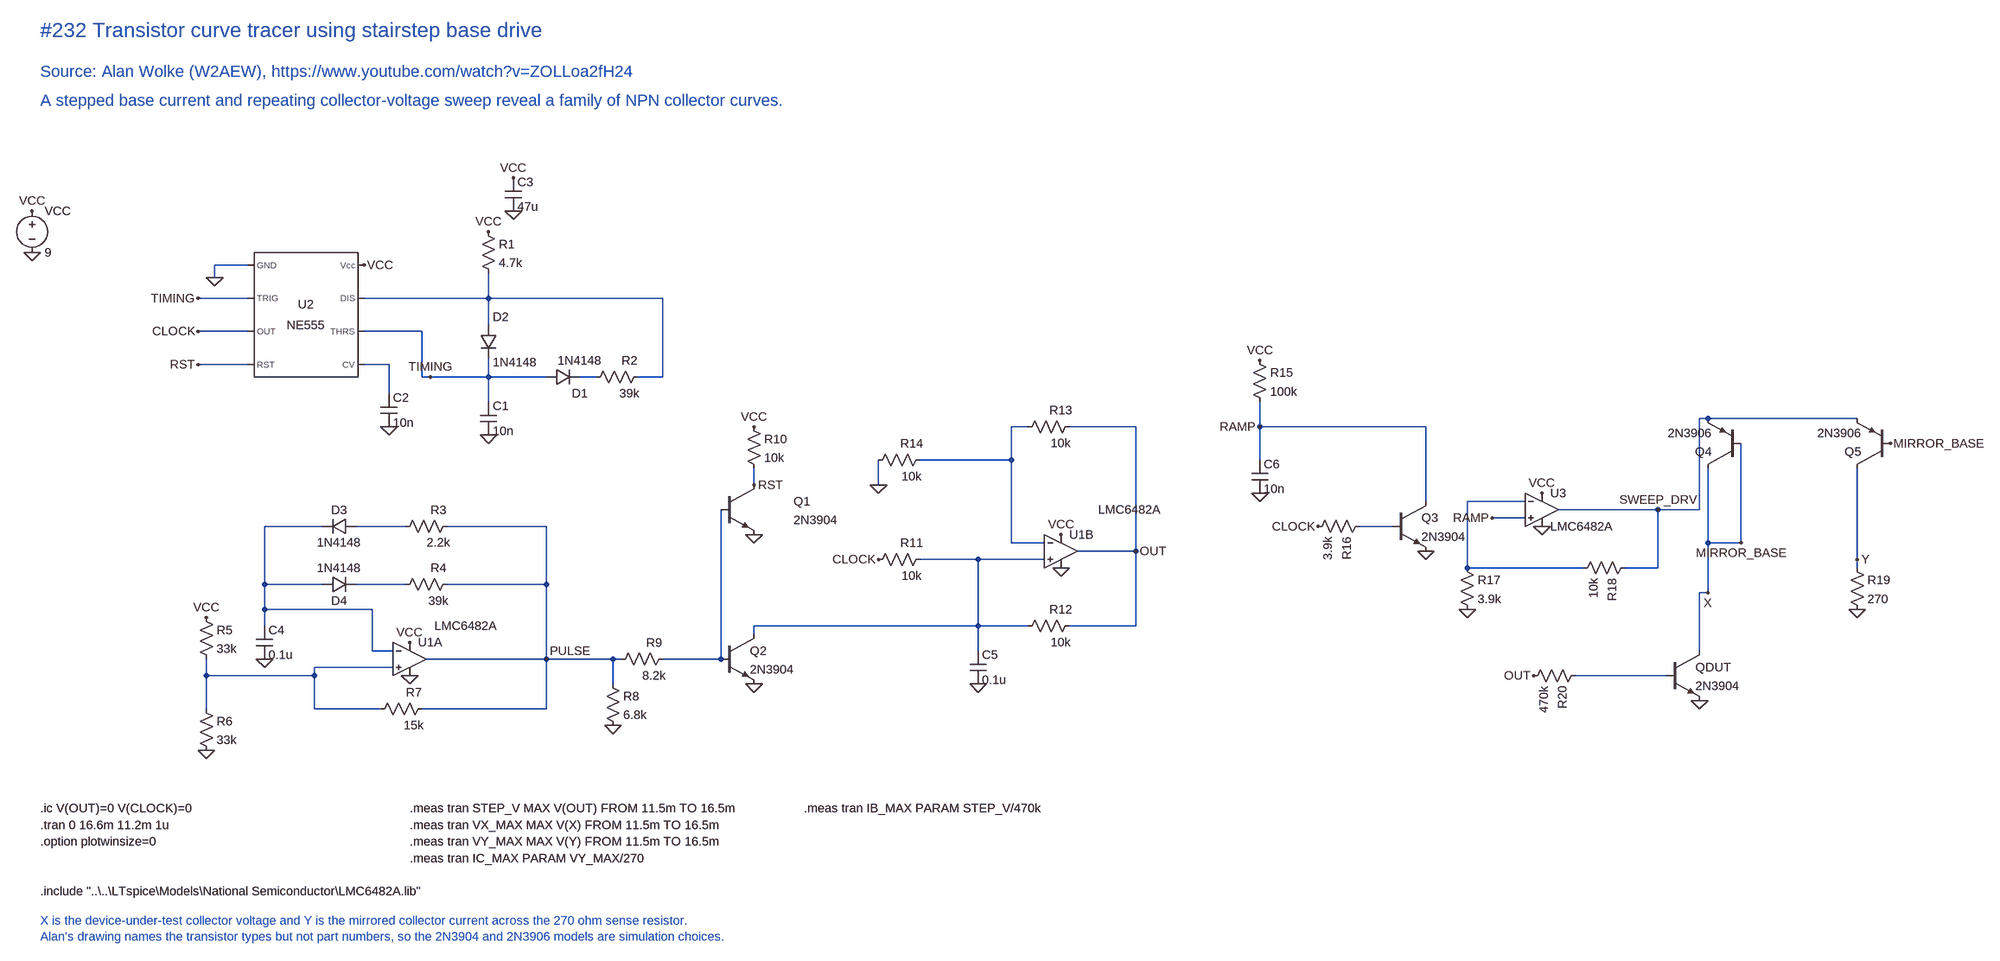
[diagram p0: schematic Transistor curve tracer.asc]
Transistor curve tracer.asc, the LTspice schematic file:
Version 4
SHEET 1 3200 1500
SYMBOL voltage -928 -16 R0
SYMATTR InstName VCC
SYMATTR Value 9
FLAG -928 0 VCC
FLAG -928 80 0
SYMBOL Misc\NE555 -400 200 R0
SYMATTR InstName U2
SYMATTR Value NE555
WIRE -512 104 -576 104
WIRE -576 104 -576 128
FLAG -576 128 0
WIRE -512 232 -608 232
FLAG -608 232 CLOCK
WIRE -512 296 -608 296
FLAG -608 296 RST
FLAG -288 104 VCC
SYMBOL res -64 24 R0
SYMATTR InstName R1
SYMATTR Value 4.7k
FLAG -48 40 VCC
WIRE -48 120 -48 168
WIRE -288 168 -48 168
WIRE -48 168 -48 220
SYMBOL diode -64 220 R0
WINDOW 0 24 -16 Left 2
WINDOW 3 24 72 Left 2
SYMATTR InstName D2
SYMATTR Value 1N4148
WIRE -48 284 -48 320
WIRE -512 168 -608 168
FLAG -608 168 TIMING
WIRE -288 232 -176 232
WIRE -176 232 -176 320
WIRE -176 320 -48 320
FLAG -160 320 TIMING
SYMBOL cap -64 368 R0
SYMATTR InstName C1
SYMATTR Value 10n
WIRE -48 320 -48 368
FLAG -48 432 0
SYMBOL diode 64 336 R270
WINDOW 0 0 64 VBottom 2
WINDOW 3 32 64 VTop 2
SYMATTR InstName D1
SYMATTR Value 1N4148
WIRE -48 320 64 320
SYMBOL res 256 304 R90
WINDOW 0 0 32 VBottom 2
WINDOW 3 32 32 VTop 2
SYMATTR InstName R2
SYMATTR Value 39k
WIRE 128 320 160 320
WIRE 240 320 288 320
WIRE 288 320 288 168
WIRE -48 168 288 168
SYMBOL cap -256 352 R0
SYMATTR InstName C2
SYMATTR Value 10n
WIRE -288 296 -240 296
WIRE -240 296 -240 352
FLAG -240 416 0
SYMBOL cap -16 -64 R0
SYMATTR InstName C3
SYMATTR Value 47u
FLAG 0 -64 VCC
FLAG 0 0 0
SYMBOL OpAmps\opamp2 -200 800 R0
WINDOW 3 48 0 Left 2
SYMATTR InstName U1A
SYMATTR Value LMC6482A
FLAG -200 832 VCC
FLAG -200 896 0
SYMBOL cap -496 800 R0
SYMATTR InstName C4
SYMATTR Value 0.1u
FLAG -480 864 0
WIRE -480 608 -480 800
WIRE -480 768 -272 768
WIRE -272 768 -272 848
WIRE -272 848 -232 848
SYMBOL diode -304 592 R90
WINDOW 0 0 32 VBottom 2
WINDOW 3 32 32 VTop 2
SYMATTR InstName D3
SYMATTR Value 1N4148
WIRE -480 608 -368 608
SYMBOL res -112 592 R90
WINDOW 0 0 32 VBottom 2
WINDOW 3 32 32 VTop 2
SYMATTR InstName R3
SYMATTR Value 2.2k
WIRE -304 608 -208 608
WIRE -128 608 64 608
SYMBOL diode -368 736 R270
WINDOW 0 0 32 VBottom 2
WINDOW 3 32 32 VTop 2
SYMATTR InstName D4
SYMATTR Value 1N4148
WIRE -480 720 -368 720
SYMBOL res -112 704 R90
WINDOW 0 0 32 VBottom 2
WINDOW 3 32 32 VTop 2
SYMATTR InstName R4
SYMATTR Value 39k
WIRE -304 720 -208 720
WIRE -128 720 64 720
WIRE 64 608 64 864
WIRE -168 864 64 864
FLAG 64 864 PULSE
SYMBOL res -608 768 R0
SYMATTR InstName R5
SYMATTR Value 33k
FLAG -592 784 VCC
WIRE -592 864 -592 896
SYMBOL res -608 944 R0
SYMATTR InstName R6
SYMATTR Value 33k
WIRE -592 896 -592 960
FLAG -592 1040 0
WIRE -592 896 -384 896
WIRE -384 880 -384 896
WIRE -384 880 -232 880
SYMBOL res -160 944 R90
WINDOW 0 0 32 VBottom 2
WINDOW 3 32 32 VTop 2
SYMATTR InstName R7
SYMATTR Value 15k
WIRE -384 896 -384 960
WIRE -384 960 -256 960
WIRE -176 960 64 960
WIRE 64 864 64 960
SYMBOL res 176 896 R0
SYMATTR InstName R8
SYMATTR Value 6.8k
WIRE 64 864 192 864
WIRE 192 864 192 912
FLAG 192 992 0
SYMBOL res 304 848 R90
WINDOW 0 0 32 VBottom 2
WINDOW 3 32 32 VTop 2
SYMATTR InstName R9
SYMATTR Value 8.2k
WIRE 64 864 208 864
WIRE 288 864 400 864
SYMBOL npn 400 528 R0
WINDOW 0 140 32 Left 2
WINDOW 3 140 68 Left 2
SYMATTR InstName Q1
SYMATTR Value 2N3904
SYMBOL npn 400 816 R0
SYMATTR InstName Q2
SYMATTR Value 2N3904
WIRE 400 576 400 864
FLAG 464 624 0
FLAG 464 912 0
SYMBOL res 448 400 R0
SYMATTR InstName R10
SYMATTR Value 10k
FLAG 464 416 VCC
WIRE 464 496 464 528
FLAG 464 528 RST
SYMBOL OpAmps\opamp2 1056 592 R0
WINDOW 3 72 -16 Left 2
SYMATTR InstName U1B
SYMATTR Value LMC6482A
FLAG 1056 624 VCC
FLAG 1056 688 0
SYMBOL res 800 656 R90
WINDOW 0 0 32 VBottom 2
WINDOW 3 32 32 VTop 2
SYMATTR InstName R11
SYMATTR Value 10k
FLAG 704 672 CLOCK
WIRE 784 672 1024 672
WIRE 464 816 464 800
WIRE 464 800 896 800
WIRE 896 672 896 848
SYMBOL cap 880 848 R0
SYMATTR InstName C5
SYMATTR Value 0.1u
FLAG 896 912 0
SYMBOL res 1088 784 R90
WINDOW 0 0 32 VBottom 2
WINDOW 3 32 32 VTop 2
SYMATTR InstName R12
SYMATTR Value 10k
WIRE 896 800 992 800
WIRE 1072 800 1200 800
WIRE 1088 656 1200 656
WIRE 1200 416 1200 800
FLAG 1200 656 OUT
SYMBOL res 1088 400 R90
WINDOW 0 0 32 VBottom 2
WINDOW 3 32 32 VTop 2
SYMATTR InstName R13
SYMATTR Value 10k
WIRE 960 416 992 416
WIRE 1072 416 1200 416
WIRE 960 416 960 640
WIRE 960 640 1024 640
SYMBOL res 800 464 R90
WINDOW 0 0 32 VBottom 2
WINDOW 3 32 32 VTop 2
SYMATTR InstName R14
SYMATTR Value 10k
WIRE 704 480 704 528
FLAG 704 528 0
WIRE 784 480 960 480
SYMBOL res 1520 272 R0
SYMATTR InstName R15
SYMATTR Value 100k
FLAG 1536 288 VCC
WIRE 1536 368 1536 416
SYMBOL cap 1520 480 R0
SYMATTR InstName C6
SYMATTR Value 10n
WIRE 1536 416 1536 480
FLAG 1536 544 0
SYMBOL res 1744 592 R90
SYMATTR InstName R16
SYMATTR Value 3.9k
FLAG 1648 608 CLOCK
WIRE 1728 608 1792 608
SYMBOL npn 1792 560 R0
SYMATTR InstName Q3
SYMATTR Value 2N3904
WIRE 1536 416 1856 416
WIRE 1856 416 1856 560
FLAG 1856 656 0
FLAG 1536 416 RAMP
SYMBOL OpAmps\opamp2 2080 512 R0
SYMATTR InstName U3
SYMATTR Value LMC6482A
FLAG 2080 544 VCC
FLAG 2080 608 0
WIRE 1984 592 2048 592
FLAG 1984 592 RAMP
SYMBOL res 1920 672 R0
SYMATTR InstName R17
SYMATTR Value 3.9k
FLAG 1936 768 0
WIRE 1936 560 1936 688
WIRE 1936 560 2048 560
SYMBOL res 2256 672 R90
SYMATTR InstName R18
SYMATTR Value 10k
WIRE 1936 688 2160 688
WIRE 2112 576 2304 576
WIRE 2240 688 2304 688
WIRE 2304 576 2304 688
FLAG 2304 576 SWEEP_DRV
SYMBOL pnp 2464 496 R180
SYMATTR InstName Q4
SYMATTR Value 2N3906
SYMBOL pnp 2752 496 R180
SYMATTR InstName Q5
SYMATTR Value 2N3906
WIRE 2304 576 2384 576
WIRE 2384 400 2384 576
WIRE 2384 400 2400 400
WIRE 2400 400 2688 400
WIRE 2464 448 2464 640
WIRE 2400 640 2464 640
FLAG 2464 640 MIRROR_BASE
FLAG 2752 448 MIRROR_BASE
WIRE 2400 496 2400 640
WIRE 2688 496 2688 688
SYMBOL res 2672 672 R0
SYMATTR InstName R19
SYMATTR Value 270
FLAG 2688 768 0
FLAG 2688 672 Y
SYMBOL res 2160 880 R90
SYMATTR InstName R20
SYMATTR Value 470k
FLAG 2064 896 OUT
WIRE 2144 896 2320 896
SYMBOL npn 2320 848 R0
SYMATTR InstName QDUT
SYMATTR Value 2N3904
FLAG 2384 944 0
WIRE 2384 848 2384 736
WIRE 2384 736 2400 736
WIRE 2400 640 2400 736
FLAG 2400 736 X
TEXT -912 -384 Left 4 ;#232 Transistor curve tracer using stairstep base drive
TEXT -912 -304 Left 3 ;Source: Alan Wolke (W2AEW), https://www.youtube.com/watch?v=ZOLLoa2fH24
TEXT -912 -248 Left 3 ;A stepped base current and repeating collector-voltage sweep reveal a family of NPN collector curves.
TEXT -912 1152 Left 2 !.ic V(OUT)=0 V(CLOCK)=0
TEXT -912 1184 Left 2 !.tran 0 16.6m 11.2m 1u
TEXT -912 1216 Left 2 !.option plotwinsize=0
TEXT -200 1152 Left 2 !.meas tran STEP_V MAX V(OUT) FROM 11.5m TO 16.5m
TEXT -200 1184 Left 2 !.meas tran VX_MAX MAX V(X) FROM 11.5m TO 16.5m
TEXT -200 1216 Left 2 !.meas tran VY_MAX MAX V(Y) FROM 11.5m TO 16.5m
TEXT -200 1248 Left 2 !.meas tran IC_MAX PARAM VY_MAX/270
TEXT 560 1152 Left 2 !.meas tran IB_MAX PARAM STEP_V/470k
TEXT -912 1312 Left 2 !.include "..\..\LTspice\Models\National Semiconductor\LMC6482A.lib"
TEXT -912 1368 Left 2 ;X is the device-under-test collector voltage and Y is the mirrored collector current across the 270 ohm sense resistor.\nAlan's drawing names the transistor types but not part numbers, so the 2N3904 and 2N3906 models are simulation choices.

The netlist it stands for:
* Transistor curve tracer.asc
VCC VCC 0 9
XU2 0 TIMING CLOCK RST N003 TIMING N001 VCC NE555  ; pins GND TRIG OUT RST CV THRS DIS Vcc
R1 VCC N001 4.7k
D2 N001 TIMING 1N4148
C1 TIMING 0 10n
D1 TIMING N002 1N4148
R2 N001 N002 39k
C2 N003 0 10n
C3 VCC 0 47u
XU1A N007 N004 VCC 0 PULSE LMC6482A  ; pins In+ In- V+ V- OUT
C4 N004 0 0.1u
D3 N005 N004 1N4148
R3 PULSE N005 2.2k
D4 N004 N006 1N4148
R4 PULSE N006 39k
R5 VCC N007 33k
R6 N007 0 33k
R7 PULSE N007 15k
R8 PULSE 0 6.8k
R9 N008 PULSE 8.2k
Q1 RST N008 0 0 2N3904
Q2 N009 N008 0 0 2N3904
R10 VCC RST 10k
XU1B N009 N010 VCC 0 OUT LMC6482A  ; pins In+ In- V+ V- OUT
R11 N009 CLOCK 10k
C5 N009 0 0.1u
R12 OUT N009 10k
R13 OUT N010 10k
R14 N010 0 10k
R15 VCC RAMP 100k
C6 RAMP 0 10n
R16 N011 CLOCK 3.9k
Q3 RAMP N011 0 0 2N3904
XU3 RAMP N012 VCC 0 SWEEP_DRV LMC6482A  ; pins In+ In- V+ V- OUT
R17 N012 0 3.9k
R18 SWEEP_DRV N012 10k
Q4 X X SWEEP_DRV 0 2N3906
Q5 Y X SWEEP_DRV 0 2N3906
R19 Y 0 270
R20 N013 OUT 470k
QDUT X N013 0 0 2N3904
.model D D
.lib standard.dio
.model NPN NPN
.model PNP PNP
.lib standard.bjt
* #232 Transistor curve tracer using stairstep base drive
* Source: Alan Wolke (W2AEW), https://www.youtube.com/watch?v=ZOLLoa2fH24
* A stepped base current and repeating collector-voltage sweep reveal a family of NPN collector curves.
.ic V(OUT)=0 V(CLOCK)=0
.tran 0 16.6m 11.2m 1u
.option plotwinsize=0
.meas tran STEP_V MAX V(OUT) FROM 11.5m TO 16.5m
.meas tran VX_MAX MAX V(X) FROM 11.5m TO 16.5m
.meas tran VY_MAX MAX V(Y) FROM 11.5m TO 16.5m
.meas tran IC_MAX PARAM VY_MAX/270
.meas tran IB_MAX PARAM STEP_V/470k
.include "..\..\LTspice\Models\National Semiconductor\LMC6482A.lib"
* X is the device-under-test collector voltage and Y is the mirrored collector current across the 270 ohm sense resistor.
* Alan's drawing names the transistor types but not part numbers, so the 2N3904 and 2N3906 models are simulation choices.
.lib NE555.sub
.backanno
.end